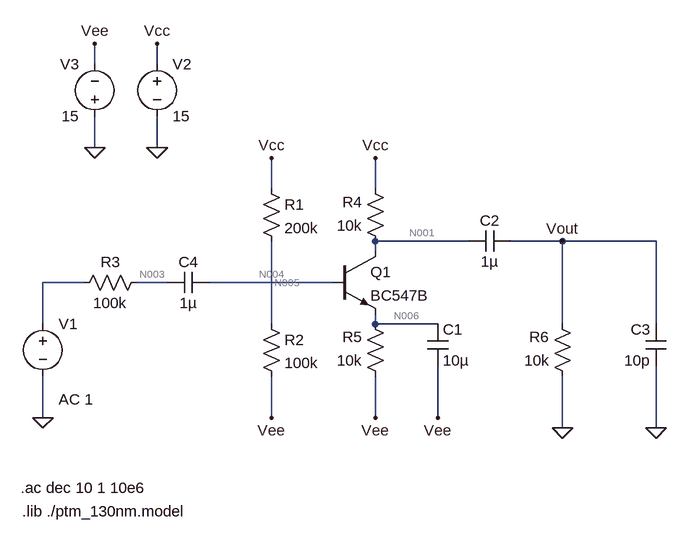
[diagram p0: schematic Draft1.asc]
Draft1.asc, the LTspice schematic file:
Version 4
SHEET 1 916 680
WIRE -112 -160 -112 -192
WIRE -16 -160 -16 -192
WIRE -112 -32 -112 -80
WIRE -16 -32 -16 -80
WIRE 160 32 160 -16
WIRE 320 32 320 -16
WIRE 464 112 320 112
WIRE 608 112 528 112
WIRE 752 112 608 112
WIRE 320 128 320 112
WIRE -128 176 -192 176
WIRE 0 176 -48 176
WIRE 256 176 64 176
WIRE -192 240 -192 176
WIRE 160 240 160 112
WIRE 320 240 320 224
WIRE 416 240 320 240
WIRE 608 240 608 112
WIRE 752 240 752 112
WIRE -192 384 -192 320
WIRE 160 384 160 320
WIRE 320 384 320 320
WIRE 416 384 416 304
WIRE 608 400 608 320
WIRE 752 400 752 304
FLAG 608 400 0
FLAG 752 400 0
FLAG 320 384 Vee
FLAG 416 384 Vee
FLAG 160 384 Vee
FLAG 320 -16 Vcc
FLAG 160 -16 Vcc
FLAG -16 -32 0
FLAG -112 -32 0
FLAG -16 -192 Vcc
FLAG -112 -192 Vee
FLAG -192 384 0
FLAG 608 112 Vout
SYMBOL res 144 16 R0
SYMATTR InstName R1
SYMATTR Value 200k
SYMBOL res 144 224 R0
SYMATTR InstName R2
SYMATTR Value 100k
SYMBOL res -32 160 R90
WINDOW 0 0 56 VBottom 2
WINDOW 3 32 56 VTop 2
SYMATTR InstName R3
SYMATTR Value 100k
SYMBOL res 336 128 R180
WINDOW 0 36 76 Left 2
WINDOW 3 36 40 Left 2
SYMATTR InstName R4
SYMATTR Value 10k
SYMBOL res 336 336 R180
WINDOW 0 36 76 Left 2
WINDOW 3 36 40 Left 2
SYMATTR InstName R5
SYMATTR Value 10k
SYMBOL res 624 336 R180
WINDOW 0 36 76 Left 2
WINDOW 3 36 40 Left 2
SYMATTR InstName R6
SYMATTR Value 10k
SYMBOL cap 400 240 R0
SYMATTR InstName C1
SYMATTR Value 10µ
SYMBOL cap 528 96 R90
WINDOW 0 0 32 VBottom 2
WINDOW 3 32 32 VTop 2
SYMATTR InstName C2
SYMATTR Value 1µ
SYMBOL cap 768 304 R180
WINDOW 0 24 56 Left 2
WINDOW 3 24 8 Left 2
SYMATTR InstName C3
SYMATTR Value 10p
SYMBOL cap 0 192 R270
WINDOW 0 32 32 VTop 2
WINDOW 3 0 32 VBottom 2
SYMATTR InstName C4
SYMATTR Value 1µ
SYMBOL npn 256 128 R0
SYMATTR InstName Q1
SYMATTR Value BC547B
SYMBOL voltage -192 224 R0
WINDOW 123 24 132 Left 2
WINDOW 39 0 0 Left 0
SYMATTR InstName V1
SYMATTR Value ""
SYMATTR Value2 AC 1
SYMBOL voltage -16 -176 R0
WINDOW 123 0 0 Left 0
WINDOW 39 0 0 Left 0
SYMATTR InstName V2
SYMATTR Value 15
SYMBOL voltage -112 -64 R180
WINDOW 0 24 96 Left 2
WINDOW 3 24 16 Left 2
WINDOW 123 0 0 Left 0
WINDOW 39 0 0 Left 0
SYMATTR InstName V3
SYMATTR Value 15
TEXT -226 492 Left 2 !.ac dec 10 1 10e6
TEXT -224 528 Left 2 !.lib ./ptm_130nm.model

The netlist it stands for:
* Draft1.asc
R1 Vcc N005 200k
R2 N005 Vee 100k
R3 N003 N002 100k
R4 N001 Vcc 10k
R5 Vee N006 10k
R6 0 Vout 10k
C1 N006 Vee 10µ
C2 Vout N001 1µ
C3 0 Vout 10p
C4 N003 N004 1µ
Q1 N001 N004 N006 0 BC547B
V1 N002 0 AC 1
V2 Vcc 0 15
V3 0 Vee 15
.model NPN NPN
.model PNP PNP
.lib standard.bjt
.ac dec 10 1 10e6
.lib ./ptm_130nm.model
.backanno
.end

* Results of the author's LTspice run, read from the files saved beside the schematic
* Operating Point, zero values left out:
*   V(vcc) = 15 V
*   V(n005) = -5 V
*   V(vee) = -15 V
*   V(n001) = 15 V
*   V(n006) = -15 V
*   V(n004) = -14.68 V
*   Ic(Q1) = 7.813 nA
*   Ie(Q1) = -7.813 nA
*   I(R5) = -7.813 nA
*   I(R4) = -7.813 nA
*   I(R2) = 100 µA
*   I(R1) = 100 µA
*   I(V3) = -100 µA
*   I(V2) = -100 µA
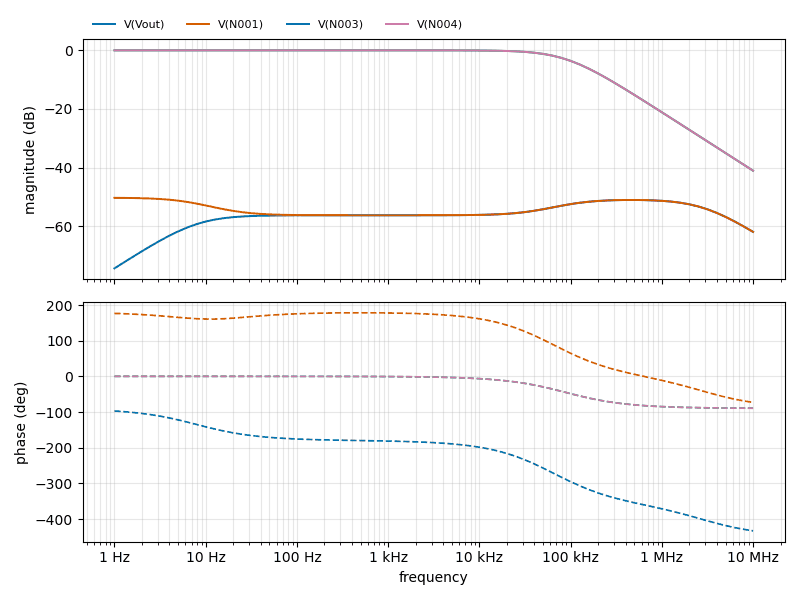
[diagram p1: AC Analysis of Draft1.asc, plotted from the saved traces]
* AC Analysis, 1 run:
*   V(Vout): -74.35 dB at 1 Hz, -61.91 dB at 10 MHz, peak -51.03 dB at 501.2 kHz, 3 dB below the peak at 52.95 kHz and 3.035 MHz
*   V(N001): -50.30 dB at 1 Hz, -61.91 dB at 10 MHz, peak -50.30 dB at 1 Hz, 3 dB below the peak at 11.53 Hz
*   V(N003): -0.00 dB at 1 Hz, -41.04 dB at 10 MHz, peak -0.00 dB at 1 Hz, 3 dB below the peak at 87.67 kHz
*   V(N004): -0.00 dB at 1 Hz, -41.04 dB at 10 MHz, peak -0.00 dB at 3.162 Hz, 3 dB below the peak at 87.67 kHz